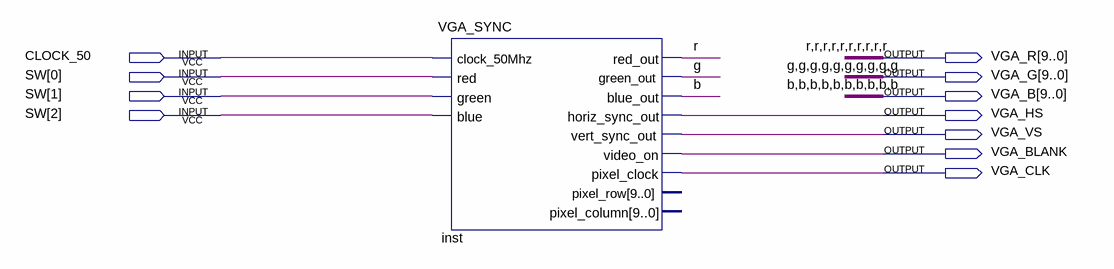
[diagram p0: schematic sheet]
// Quartus schematic VGA_SYNC_TEST.bdf as structural Verilog: 1 symbols, 11 pins
module VGA_SYNC_TEST (
  input  CLOCK_50,
  input  [2:0] SW,
  output [9:0] VGA_R,
  output [9:0] VGA_G,
  output [9:0] VGA_B,
  output VGA_HS,
  output VGA_VS,
  output VGA_BLANK,
  output VGA_CLK
);

  VGA_SYNC inst (
    .clock_50Mhz(CLOCK_50), .red(SW[0]), .green(SW[1]), .blue(SW[2]), .red_out(VGA_R[9]),
    .green_out(VGA_G[9]), .blue_out(VGA_B[9]), .horiz_sync_out(VGA_HS), .vert_sync_out(VGA_VS),
    .video_on(VGA_BLANK), .pixel_clock(VGA_CLK));  // open: pixel_row, pixel_column

  assign VGA_B[8:0] = {9{VGA_B[9]}};
  assign VGA_G[8:0] = {9{VGA_G[9]}};
  assign VGA_R[8:0] = {9{VGA_R[9]}};

  // Other names for the same wires on the sheet: b = VGA_B[9]; g = VGA_G[9]; r = VGA_R[9]
endmodule
